# Altium schematic sheet BAT_Input.SchDoc
size A; SheetNumber: 3; SheetTotal: 4
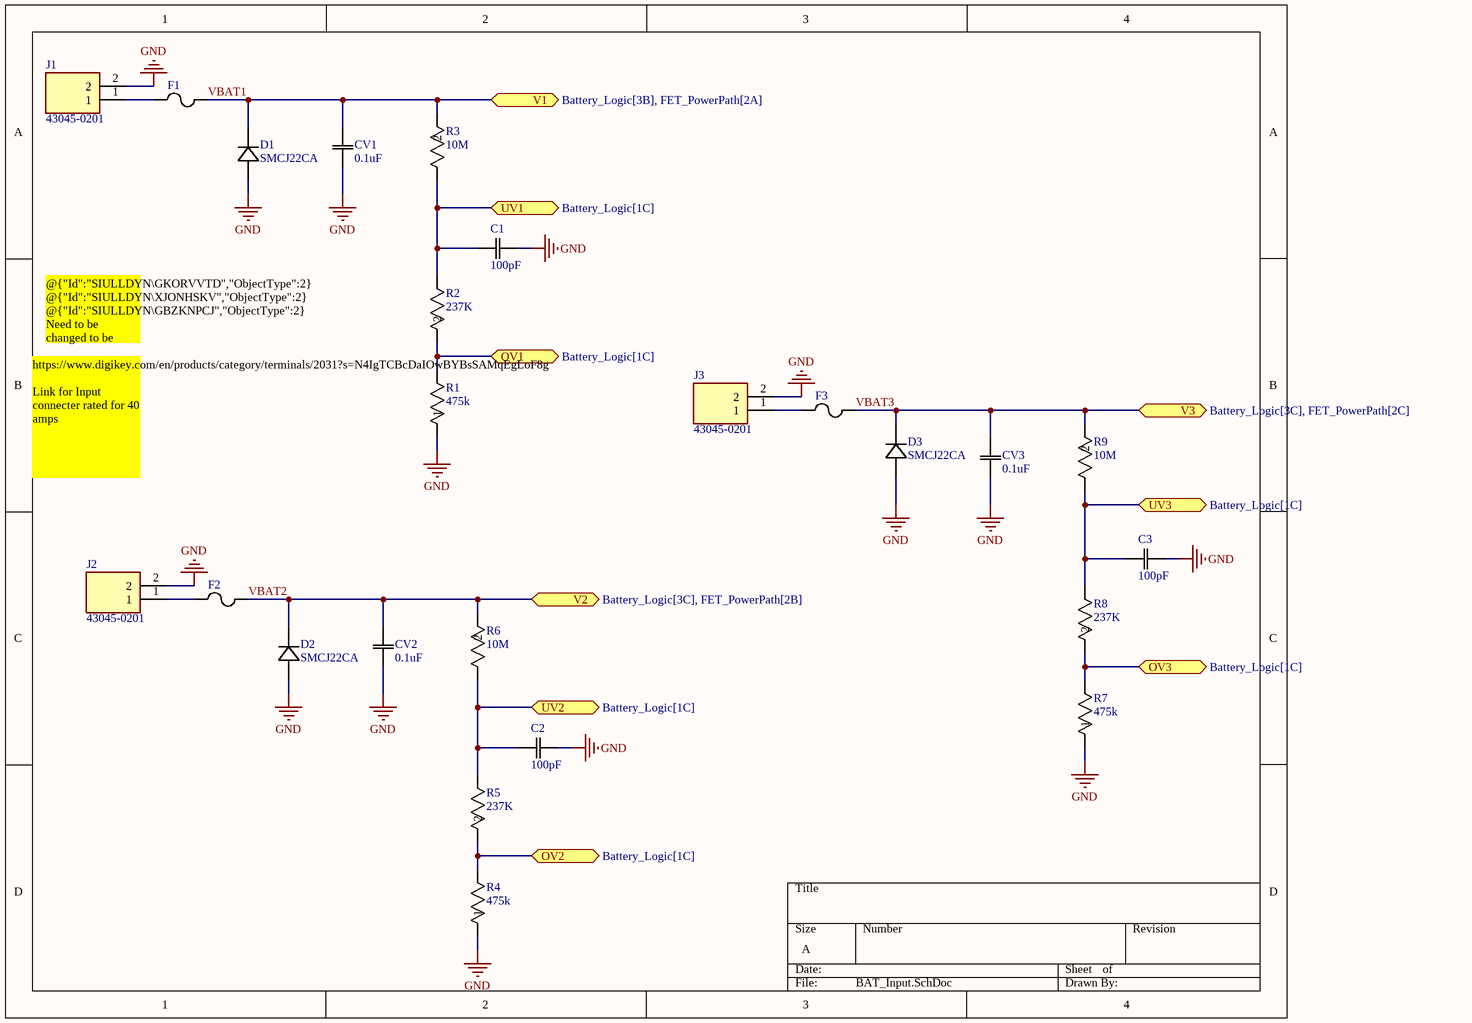
[diagram p0: BAT_Input.SchDoc]

## Parts
C1  100pF  [CAP_CC0402_YAG]
C2  100pF  [CAP_CC0402_YAG]
C3  100pF  [CAP_CC0402_YAG]
CV1  0.1uF  [CAP_GCM1555_0402_MUR]
CV2  0.1uF  [CAP_GCM1555_0402_MUR]
CV3  0.1uF  [CAP_GCM1555_0402_MUR]
D1  SMCJ22CA  [SMCJSeries_LTF]
D2  SMCJ22CA  [SMCJSeries_LTF]
D3  SMCJ22CA  [SMCJSeries_LTF]
F1  SF-3812F4000T-2  [FUSE_L20A_BRN]  (value not drawn)
F2  SF-3812F4000T-2  [FUSE_L20A_BRN]  (value not drawn)
F3  SF-3812F4000T-2  [FUSE_L20A_BRN]  (value not drawn)
J1  43045-0201  [43045-02YY]
J2  43045-0201  [43045-02YY]
J3  43045-0201  [43045-02YY]
R1  475k  [STA_RMCF0603_STP]
R2  237K  [RC0603N_PAN]
R3  10M  [RES_CRCW_0603]
R4  475k  [STA_RMCF0603_STP]
R5  237K  [RC0603N_PAN]
R6  10M  [RES_CRCW_0603]
R7  475k  [STA_RMCF0603_STP]
R8  237K  [RC0603N_PAN]
R9  10M  [RES_CRCW_0603]

## Ports
OV1 (bidir, see Battery_Logic[1C]), OV2 (bidir, see Battery_Logic[1C]), OV3 (bidir, see Battery_Logic[1C]), UV1 (bidir, see Battery_Logic[1C]), UV2 (bidir, see Battery_Logic[1C]), UV3 (bidir, see Battery_Logic[1C]), V1 (bidir, see Battery_Logic[3B], FET_PowerPath[2A]), V2 (bidir, see Battery_Logic[3C], FET_PowerPath[2B]), V3 (bidir, see Battery_Logic[3C], FET_PowerPath[2C])

## Nets
GND: C1.2 C2.2 C3.1 CV1.1 CV2.1 CV3.1 D1.2 D2.2 D3.2 J1.2 J2.2 J3.2 R1.1 R4.1 R7.1
OV1: R1.2 R2.2 ; port OV1
OV2: R4.2 R5.2 ; port OV2
OV3: R7.2 R8.2 ; port OV3
UV1: C1.1 R2.1 R3.1 ; port UV1
UV2: C2.1 R5.1 R6.1 ; port UV2
UV3: C3.2 R8.1 R9.1 ; port UV3
VBAT1: CV1.2 D1.1 F1.2 R3.2 ; port V1
VBAT2: CV2.2 D2.1 F2.2 R6.2 ; port V2
VBAT3: CV3.2 D3.1 F3.2 R9.2 ; port V3
NetF1_1: F1.1 J1.1
NetF2_1: F2.1 J2.1
NetF3_1: F3.1 J3.1

## Notes on the sheet
- @{"Id":"SIULLDYN\GKORVVTD","ObjectType":2} @{"Id":"SIULLDYN\XJONHSKV","ObjectType":2} @{"Id":"SIULLDYN\GBZKNPCJ","ObjectType":2} Need to be changed to be rated for 40A. Connecters in from battery terminals.
- https://www.digikey.com/en/products/category/terminals/2031?s=N4IgTCBcDaIOwBYBsSAMqEgLoF8g
  Link for Input connecter rated for 40 amps

## Library data of the parts
C1-C3 = CC0402JRNPO9BN101: CAPACITOR; SMT (0402); CERAMIC CHIP; 100PF; 50V; TOL=5%; TG=-55 DEGC TO +125 DEGC; TC=C0G; Manufacturer_Name: Yageo; Copyright: Copyright (C) 2025 Ultra Librarian. All rights reserved.; Manufacturer_Part_Number: CC0402JRNPO9BN101
CV1-CV3 = GCM155R71H104KE02J: Description; Manufacturer_Name: Murata; Copyright: Copyright (C) 2026 Ultra Librarian. All rights reserved.; Manufacturer_Part_Number: GCM155R71H104KE02J
D1-D3 = SMCJ22CA: No Description Available; Manufacturer_Name: Littelfuse Inc; Copyright: Copyright (C) 2026 Ultra Librarian. All rights reserved.; Manufacturer_Part_Number: SMCJ22CA
F1-F3 = SF-3812F4000T-2: Description; Manufacturer_Name: Bourns Electronics; Copyright: Copyright (C) 2026 Ultra Librarian. All rights reserved.; Manufacturer_Part_Number: SF-3812F4000T-2
J1-J3 = 43045-0201: Connector; Manufacturer_Name: Molex; Datasheet Link: https://www.molex.com/pdm_docs/sd/430450200_sd.pdf; Height: 9.9mm; Manufacturer_Part_Number: 43045-0201; Mouser Part Number: 538-43045-0201; Mouser Price/Stock: https://www.mouser.co.uk/ProductDetail/Molex/43045-0201?qs=R7%2FZKp6KZ2Y51sj1nic43g%3D%3D
R1 R4 R7 = RMCF0603FT475K: No Description Available; Manufacturer_Name: Stackpole International; Copyright: Copyright (C) 2026 Ultra Librarian. All rights reserved.; Manufacturer_Part_Number: RMCF0603FT475K
R2 R5 R8 = ERJ-3EKF2373V: No Description Available; Manufacturer_Name: Panasonic; Copyright: Copyright (C) 2026 Ultra Librarian. All rights reserved.; Manufacturer_Part_Number: ERJ-3EKF2373V
R3 R6 R9 = CRCW060310M0FKEA: D11/CRCW0603 100 10M 1% ET1 e3; Manufacturer_Name: Vishay; Copyright: Copyright (C) 2025 Ultra Librarian. All rights reserved.; Manufacturer_Part_Number: CRCW060310M0FKEA